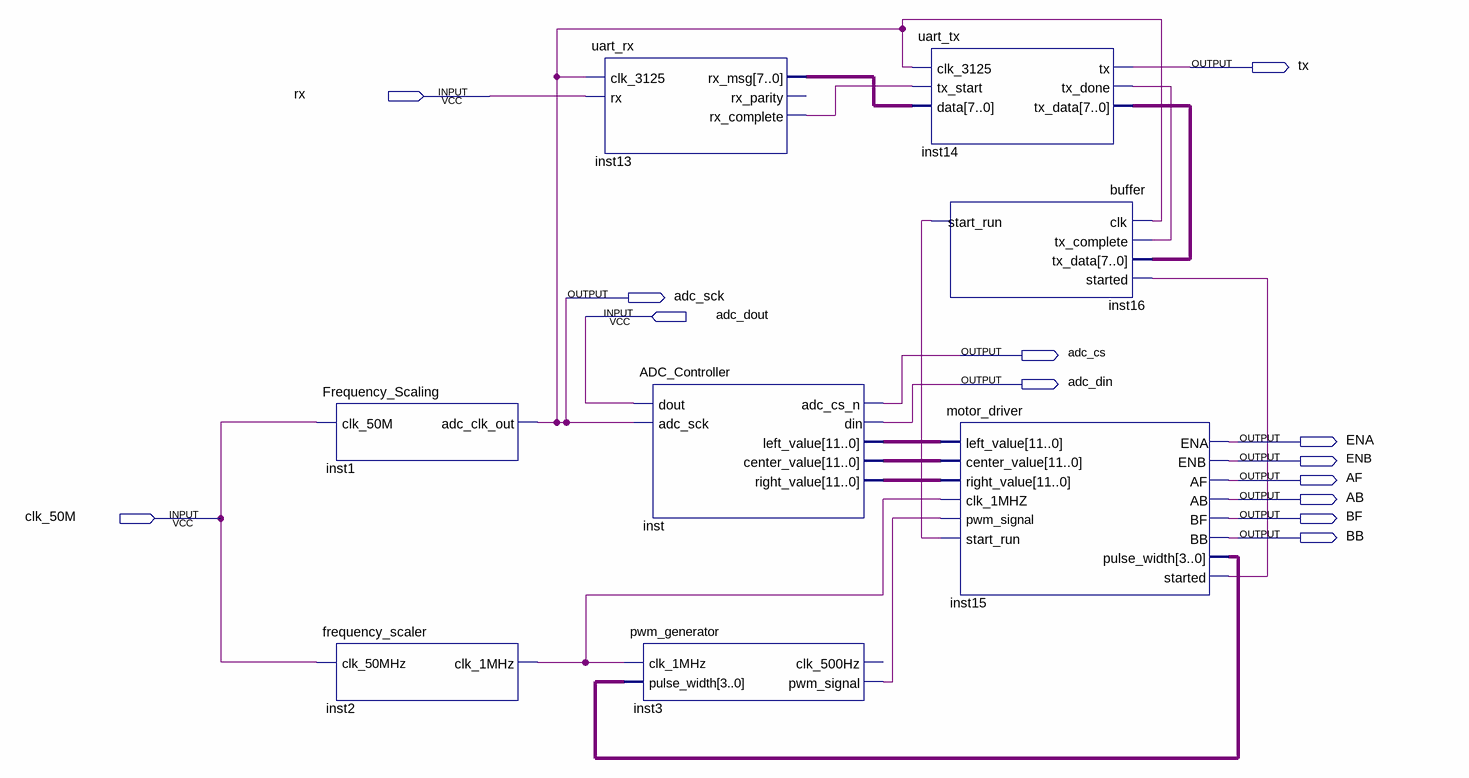
[diagram p0: schematic sheet]
// Quartus schematic LINE_FOLLOWER.bdf as structural Verilog: 8 symbols, 13 pins
module LINE_FOLLOWER (
  input  rx,
  input  adc_dout,
  input  clk_50M,
  output tx,
  output adc_sck,
  output adc_cs,
  output adc_din,
  output ENA,
  output ENB,
  output AF,
  output AB,
  output BF,
  output BB
);

  wire inst2_clk_1mhz, inst3_pwm_signal, inst13_rx_complete, inst14_tx_done, inst15_started, inst16_start_run;
  wire [3:0] inst15_pulse_width;
  wire [7:0] inst13_rx_msg, inst14_tx_data;
  wire [11:0] inst_center_value, inst_left_value, inst_right_value;

  Frequency_Scaling inst1 (.clk_50M(clk_50M), .adc_clk_out(adc_sck));
  frequency_scaler inst2 (.clk_50MHz(clk_50M), .clk_1MHz(inst2_clk_1mhz));
  uart_rx inst13 (
    .clk_3125(adc_sck), .rx(rx), .rx_msg(inst13_rx_msg), .rx_complete(inst13_rx_complete));  // open: rx_parity
  ADC_Controller inst (
    .dout(adc_dout), .adc_sck(adc_sck), .adc_cs_n(adc_cs), .din(adc_din), .left_value(inst_left_value),
    .center_value(inst_center_value), .right_value(inst_right_value));
  pwm_generator inst3 (
    .clk_1MHz(inst2_clk_1mhz), .pulse_width(inst15_pulse_width), .pwm_signal(inst3_pwm_signal));  // open: clk_500Hz
  uart_tx inst14 (
    .clk_3125(adc_sck), .tx_start(inst13_rx_complete), .data(inst13_rx_msg), .tx(tx),
    .tx_done(inst14_tx_done), .tx_data(inst14_tx_data));
  buffer inst16 (
    .clk(adc_sck), .tx_complete(inst14_tx_done), .tx_data(inst14_tx_data), .started(inst15_started),
    .start_run(inst16_start_run));
  motor_driver inst15 (
    .left_value(inst_left_value), .center_value(inst_center_value), .right_value(inst_right_value),
    .clk_1MHZ(inst2_clk_1mhz), .pwm_signal(inst3_pwm_signal), .start_run(inst16_start_run), .ENA(ENA),
    .ENB(ENB), .AF(AF), .AB(AB), .BF(BF), .BB(BB), .pulse_width(inst15_pulse_width), .started(inst15_started));
endmodule
